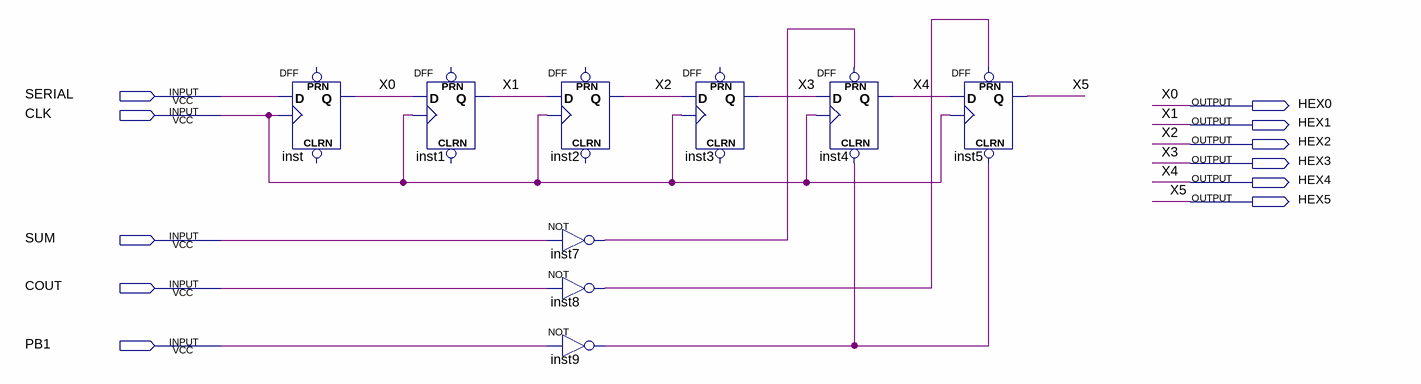
[diagram p0: schematic sheet]
// Quartus schematic Deslocamento.bdf as structural Verilog: 9 symbols, 11 pins
module Deslocamento (
  input  SERIAL,
  input  CLK,
  input  SUM,
  input  COUT,
  input  PB1,
  output HEX0,
  output HEX1,
  output HEX2,
  output HEX3,
  output HEX4,
  output HEX5
);

  wire inst7_out, inst8_out, inst9_out;

  DFF inst (.CLK(CLK), .D(SERIAL), .Q(HEX0));  // open: CLRN, PRN
  DFF inst1 (.CLK(CLK), .D(HEX0), .Q(HEX1));  // open: CLRN, PRN
  DFF inst2 (.CLK(CLK), .D(HEX1), .Q(HEX2));  // open: CLRN, PRN
  not inst7 (inst7_out, SUM);
  not inst8 (inst8_out, COUT);
  not inst9 (inst9_out, PB1);
  DFF inst3 (.CLK(CLK), .D(HEX2), .Q(HEX3));  // open: CLRN, PRN
  DFF inst4 (.CLRN(inst9_out), .CLK(CLK), .D(HEX3), .PRN(inst7_out), .Q(HEX4));
  DFF inst5 (.CLRN(inst9_out), .CLK(CLK), .D(HEX4), .PRN(inst8_out), .Q(HEX5));

  // Other names for the same wires on the sheet: X0 = HEX0; X1 = HEX1; X2 = HEX2; X3 = HEX3; X4 = HEX4; X5 = HEX5
endmodule
